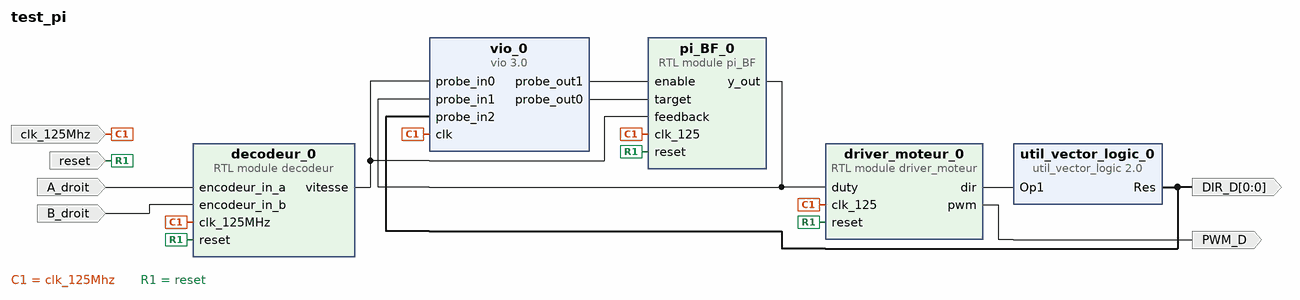
[diagram p0: block diagram of the top level]
# Vivado block design test_pi, xc7z020clg400-1, Vivado 2020.2
create_bd_design test_pi

create_bd_port -dir I -type clk clk_125Mhz
create_bd_port -dir I -type rst reset
create_bd_port -dir I A_droit
create_bd_port -dir I B_droit
create_bd_port -dir O PWM_D
create_bd_port -dir O -from 0 -to 0 DIR_D

create_bd_cell -type ip -vlnv xilinx.com:ip:vio:3.0 vio_0
set_property -dict {CONFIG.C_NUM_PROBE_IN 3 CONFIG.C_NUM_PROBE_OUT 2 CONFIG.C_PROBE_OUT0_WIDTH 16} [get_bd_cells vio_0]
create_bd_cell -type ip -vlnv xilinx.com:ip:util_vector_logic:2.0 util_vector_logic_0
set_property -dict {CONFIG.C_OPERATION not CONFIG.C_SIZE 0} [get_bd_cells util_vector_logic_0]
create_bd_cell -type module -reference pi_BF pi_BF_0
set_property -dict {CONFIG.a 1 CONFIG.b 0} [get_bd_cells pi_BF_0]
create_bd_cell -type module -reference decodeur decodeur_0
create_bd_cell -type module -reference driver_moteur driver_moteur_0

# ---- connections ----

connect_bd_net -net clk_0_1 [get_bd_ports clk_125Mhz] \
  [get_bd_pins vio_0/clk] [get_bd_pins pi_BF_0/clk_125] [get_bd_pins decodeur_0/clk_125MHz] \
  [get_bd_pins driver_moteur_0/clk_125]
connect_bd_net -net reset_0_1 [get_bd_ports reset] [get_bd_pins pi_BF_0/reset] [get_bd_pins decodeur_0/reset] [get_bd_pins driver_moteur_0/reset]
connect_bd_net [get_bd_pins vio_0/probe_out1] [get_bd_pins pi_BF_0/enable]
connect_bd_net [get_bd_pins vio_0/probe_out0] [get_bd_pins pi_BF_0/target]
connect_bd_net -net encodeur_in_a_0_1 [get_bd_ports A_droit] [get_bd_pins decodeur_0/encodeur_in_a]
connect_bd_net -net encodeur_in_b_0_1 [get_bd_ports B_droit] [get_bd_pins decodeur_0/encodeur_in_b]
connect_bd_net [get_bd_pins decodeur_0/vitesse] [get_bd_pins vio_0/probe_in0] [get_bd_pins pi_BF_0/feedback]
connect_bd_net [get_bd_pins pi_BF_0/y_out] [get_bd_pins vio_0/probe_in1] [get_bd_pins driver_moteur_0/duty]
connect_bd_net [get_bd_pins driver_moteur_0/dir] [get_bd_pins util_vector_logic_0/Op1]
connect_bd_net [get_bd_pins driver_moteur_0/pwm] [get_bd_ports PWM_D]
connect_bd_net [get_bd_pins util_vector_logic_0/Res] [get_bd_pins vio_0/probe_in2] [get_bd_ports DIR_D]

validate_bd_design
save_bd_design
